# Altium schematic sheet RK3568-USB-PCIe-Sheet.SchDoc
size 420 x 297 mm; SheetNumber: 8; SheetTotal: 25
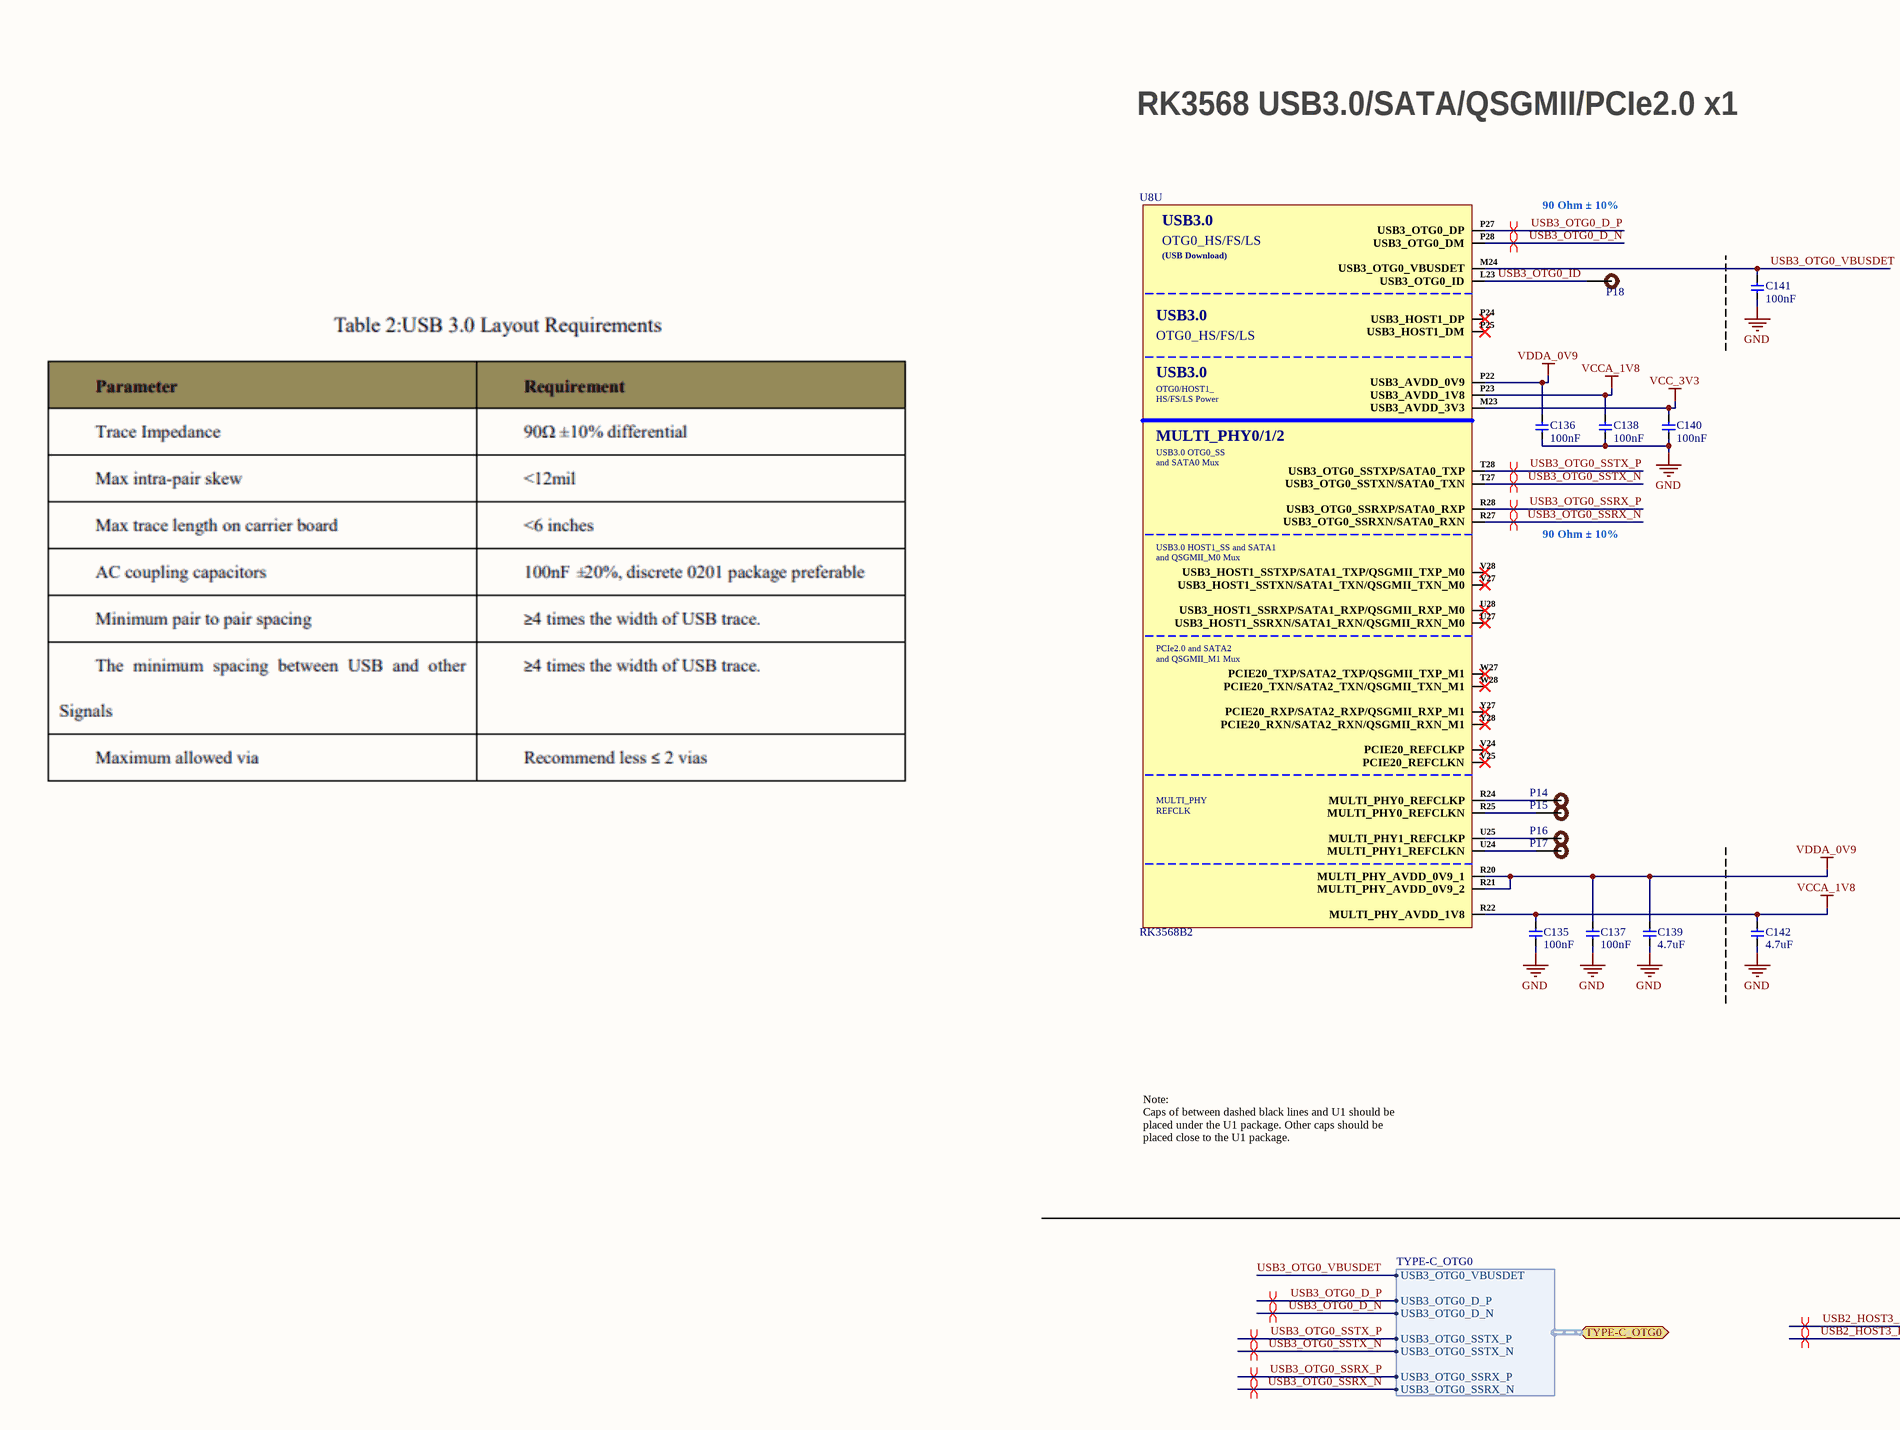
[diagram p0: RK3568-USB-PCIe-Sheet.SchDoc, left]
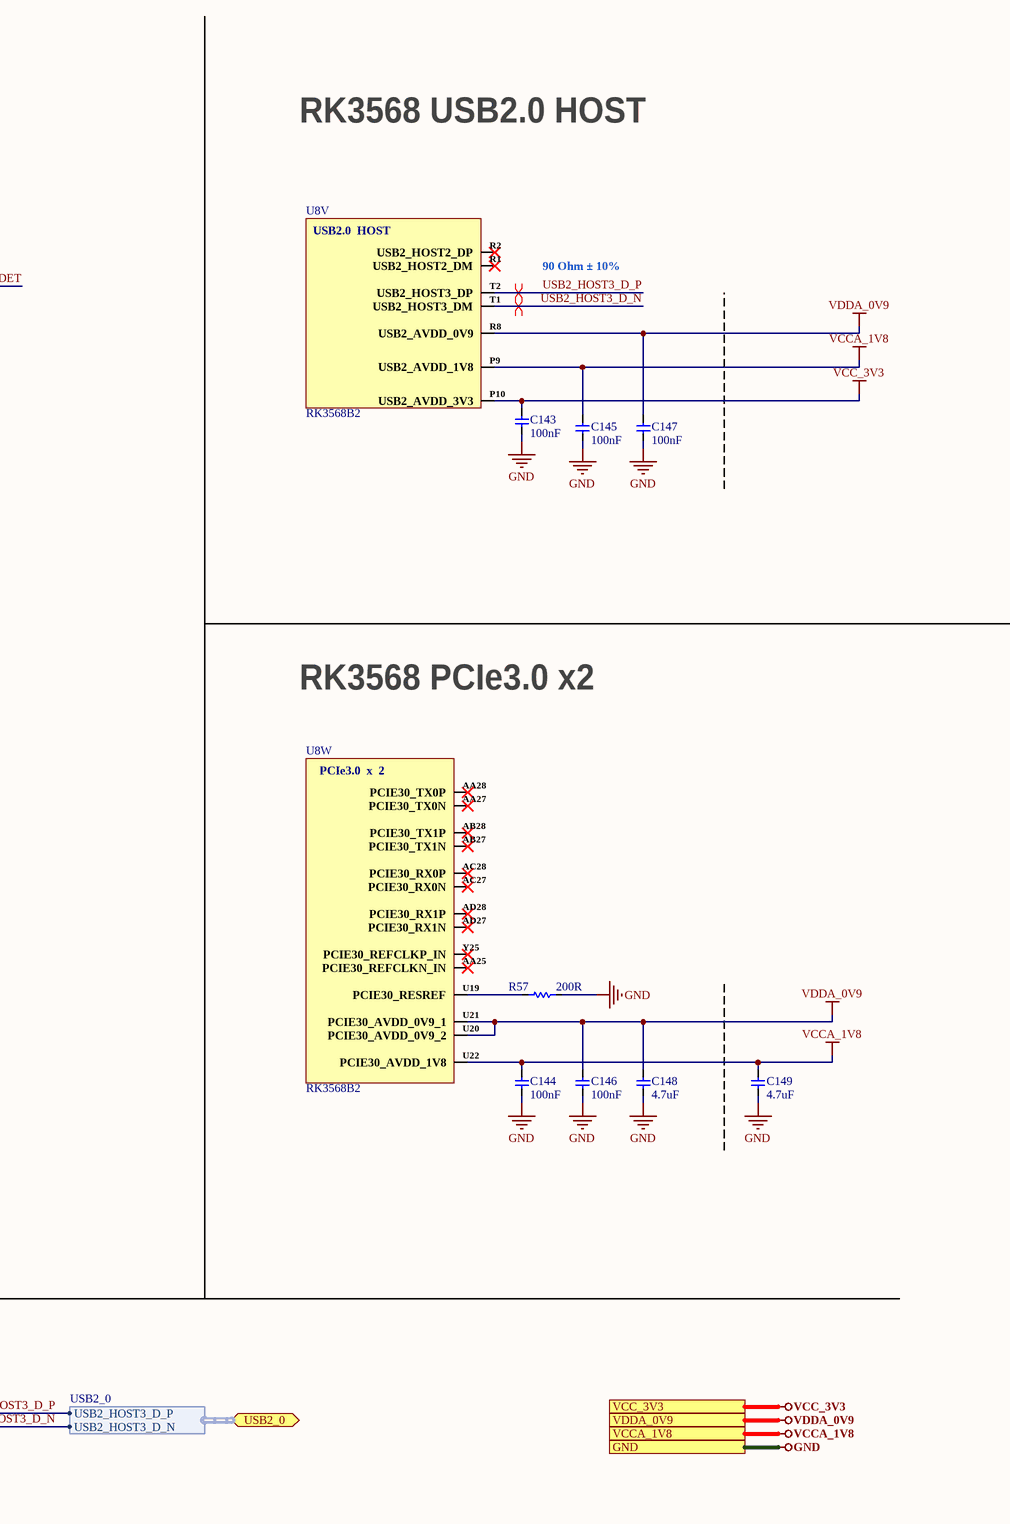
[diagram p1: RK3568-USB-PCIe-Sheet.SchDoc, right]

## Parts
C135  100nF  [CAP-0201]
C136  100nF  [CAP-0201]
C137  100nF  [CAP-0201]
C138  100nF  [CAP-0201]
C139  4.7uF  [Cap-0402]
C140  100nF  [CAP-0201]
C141  100nF  [CAP-0201]
C142  4.7uF  [Cap-0402]
C143  100nF  [CAP-0201]
C144  100nF  [CAP-0201]
C145  100nF  [CAP-0201]
C146  100nF  [CAP-0201]
C147  100nF  [CAP-0201]
C148  4.7uF  [Cap-0402]
C149  4.7uF  [Cap-0402]
P14  TEST POINT 0.5mm Dia  [Test-point - 0.5mm]  (value not drawn)  (no BOM)
P15  TEST POINT 0.5mm Dia  [Test-point - 0.5mm]  (value not drawn)  (no BOM)
P16  TEST POINT 0.5mm Dia  [Test-point - 0.5mm]  (value not drawn)  (no BOM)
P17  TEST POINT 0.5mm Dia  [Test-point - 0.5mm]  (value not drawn)  (no BOM)
P18  TEST POINT 0.5mm Dia  [Test-point - 0.5mm]  (value not drawn)  (no BOM)
R57  200R  [Res-0201]
U8  RK3568B2  [FCCSP-636L]  (parts U,V,W of 23)

## Ports
GND (see Connector-Sheet[5D], DRAM-LPDDR4x-Sheet[4D], eMMC-Sheet[4D], LED-Debug-Sheet[4D], MicroSD-SPI-Flash-Sheet[4D], Power-DC-IN-Sheet[4D], Power-Others-Sheet[4D], Power-PMIC-Sheet[4D], RK3568-Audio-Interface[4D], RK3568-Flash-SD-Controller[4D], RK3568-OSC-PMUIO-Sheet[5D], RK3568-Power-Sheet[4D], RK3568-SARADC-GPIO[4D], RK3568-VI-Interface-Sheet[4D], RK3568-VO-Interface-1[4D], RK3568-VO-Interface-2[4D], Sensors-Sheet-1[4D], Sensors-Sheet-2[5D], Type-C-Sheet[4D], USB-Ports[4D], VO-HDMI2.0-TX-Sheet[4D], VO-LCM-MIPI-DSI-TX0[4D], WIFI-BT-SDIO-Sheet[4D]), TYPE-C_OTG0 (bidir, harness TYPE-C_OTG0, see Type-C-Sheet[2D]), USB2_0 (bidir, harness USB2_0, see USB-Ports[2D]), VCC_3V3 (see eMMC-Sheet[4D], Power-PMIC-Sheet[4D], RK3568-SARADC-GPIO[4D], RK3568-VO-Interface-2[4D], VO-HDMI2.0-TX-Sheet[4D], WIFI-BT-SDIO-Sheet[4D]), VCCA_1V8 (see LED-Debug-Sheet[4D], Power-PMIC-Sheet[4D], RK3568-OSC-PMUIO-Sheet[5D], RK3568-SARADC-GPIO[4D]), VDDA_0V9 (see Power-PMIC-Sheet[3D], RK3568-OSC-PMUIO-Sheet[5D])

## Harnesses
TYPE-C_OTG0: USB3_OTG0_D_P, USB3_OTG0_D_N, USB3_OTG0_VBUSDET, USB3_OTG0_SSTX_P, USB3_OTG0_SSTX_N, USB3_OTG0_SSRX_P, USB3_OTG0_SSRX_N
USB2_0: USB2_HOST3_D_P, USB2_HOST3_D_N

## Nets
GND: C135.1 C136.1 C137.1 C138.1 C139.1 C140.1 C141.1 C142.1 C143.1 C144.1 C145.1 C146.1 C147.1 C148.1 C149.1 R57.2 ; port GND
VCC_3V3: C140.2 C143.2 U8.M23(USB3_AVDD_3V3) U8.P10(USB2_AVDD_3V3) ; port VCC_3V3
VCCA_1V8: C135.2 C138.2 C142.2 C144.2 C145.2 C149.2 U8.P9(USB2_AVDD_1V8) U8.P23(USB3_AVDD_1V8) U8.R22(MULTI_PHY_AVDD_1V8) U8.U22(PCIE30_AVDD_1V8) ; port VCCA_1V8
VDDA_0V9: C136.2 C137.2 C139.2 C146.2 C147.2 C148.2 U8.P22(USB3_AVDD_0V9) U8.R8(USB2_AVDD_0V9) U8.R20(MULTI_PHY_AVDD_0V9_1) U8.R21(MULTI_PHY_AVDD_0V9_2) U8.U20(PCIE30_AVDD_0V9_2) U8.U21(PCIE30_AVDD_0V9_1) ; port VDDA_0V9
USB2_HOST3_D_N: U8.T1(USB2_HOST3_DM) ; port USB2_0.USB2_HOST3_D_N
USB2_HOST3_D_P: U8.T2(USB2_HOST3_DP) ; port USB2_0.USB2_HOST3_D_P
USB3_OTG0_D_N: U8.P28(USB3_OTG0_DM) ; port TYPE-C_OTG0.USB3_OTG0_D_N
USB3_OTG0_D_P: U8.P27(USB3_OTG0_DP) ; port TYPE-C_OTG0.USB3_OTG0_D_P
USB3_OTG0_ID: P18.1 U8.L23(USB3_OTG0_ID)
USB3_OTG0_SSRX_N: U8.R27(USB3_OTG0_SSRXN/SATA0_RXN) ; port TYPE-C_OTG0.USB3_OTG0_SSRX_N
USB3_OTG0_SSRX_P: U8.R28(USB3_OTG0_SSRXP/SATA0_RXP) ; port TYPE-C_OTG0.USB3_OTG0_SSRX_P
USB3_OTG0_SSTX_N: U8.T27(USB3_OTG0_SSTXN/SATA0_TXN) ; port TYPE-C_OTG0.USB3_OTG0_SSTX_N
USB3_OTG0_SSTX_P: U8.T28(USB3_OTG0_SSTXP/SATA0_TXP) ; port TYPE-C_OTG0.USB3_OTG0_SSTX_P
USB3_OTG0_VBUSDET: C141.2 U8.M24(USB3_OTG0_VBUSDET) ; port TYPE-C_OTG0.USB3_OTG0_VBUSDET
NetP14_1: P14.1 U8.R24(MULTI_PHY0_REFCLKP)
NetP15_1: P15.1 U8.R25(MULTI_PHY0_REFCLKN)
NetP16_1: P16.1 U8.U25(MULTI_PHY1_REFCLKP)
NetP17_1: P17.1 U8.U24(MULTI_PHY1_REFCLKN)
NetR57_1: R57.1 U8.U19(PCIE30_RESREF)

Not connected (* = marked no-connect by the designer): U8 AA25(PCIE30_REFCLKN_IN)* AA27(PCIE30_TX0N)* AA28(PCIE30_TX0P)* AB27(PCIE30_TX1N)* AB28(PCIE30_TX1P)* AC27(PCIE30_RX0N)* AC28(PCIE30_RX0P)* AD27(PCIE30_RX1N)* AD28(PCIE30_RX1P)* P24(USB3_HOST1_DP)* P25(USB3_HOST1_DM)* R1(USB2_HOST2_DM)* R2(USB2_HOST2_DP)* U27(USB3_HOST1_SSRXN/SATA1_RXN/QSGMII_RXN_M0)* U28(USB3_HOST1_SSRXP/SATA1_RXP/QSGMII_RXP_M0)* V24(PCIE20_REFCLKP)* V25(PCIE20_REFCLKN)* V27(USB3_HOST1_SSTXN/SATA1_TXN/QSGMII_TXN_M0)* V28(USB3_HOST1_SSTXP/SATA1_TXP/QSGMII_TXP_M0)* W27(PCIE20_TXP/SATA2_TXP/QSGMII_TXP_M1)* W28(PCIE20_TXN/SATA2_TXN/QSGMII_TXN_M1)* Y25(PCIE30_REFCLKP_IN)* Y27(PCIE20_RXP/SATA2_RXP/QSGMII_RXP_M1)* Y28(PCIE20_RXN/SATA2_RXN/QSGMII_RXN_M1)*

## Layout directives
differential pair: USB2_HOST3_D_N, USB2_HOST3_D_P, USB3_OTG0_D_N, USB3_OTG0_D_P, USB3_OTG0_SSRX_N, USB3_OTG0_SSRX_P, USB3_OTG0_SSTX_N, USB3_OTG0_SSTX_P

## Notes on the sheet
- RK3568 USB3.0/SATA/QSGMII/PCIe2.0 x1
- RK3568 USB2.0 HOST
- 90 Ohm ± 10%
- RK3568 PCIe3.0 x2
- Note:
  Caps of between dashed black lines and U1 should be placed under the U1 package. Other caps should be placed close to the U1 package.
- File:
- Title:
- Date:
- Page
- Num:
- Total:
- Drawn By: Huzaifa Ali
- (in symbol RK3568B2, part U) USB3.0; OTG0_HS/FS/LS; (USB Download); OTG0/HOST1_  HS/FS/LS Power; MULTI_PHY0/1/2; USB3.0 OTG0_SS / and SATA0 Mux; USB3.0 HOST1_SS and SATA1 / and QSGMII_M0 Mux; PCIe2.0 and SATA2 / and QSGMII_M1 Mux; MULTI_PHY REFCLK
- (in symbol RK3568B2, part V) USB2.0  HOST
- (in symbol RK3568B2, part W) PCIe3.0  x  2

## Library data of the parts
C135-C138 C140 C141 C143-C147 = CC0201KRX5R6BB104: CAP CER 0.1UF 10V X5R 0201; Manufacturer: Yageo; Tolerance: 10%; Supplier 1: Mouser; Manufacturer Part Number: CC0201KRX5R6BB104; RoHS: Yes; Category: Ceramic Capacitors; Stock 1: 824403; Pricing 1: 1=0.10000, 10=0.02400, 50=0.02400, 100=0.01900, 1000=0.01100, 10000=0.00900 (USD); Mount: Surface Mount; Case/Package: 0201; Case Code (Imperial): 0201; Case Code (Metric): 0603; Weight: 6E-06oz; Min Operating Temperature: -55°C; Max Operating Temperature: 85°C; Capacitance: 100nF; Dielectric: X5R; Voltage Rating (DC): 10V; Packaging: Tape and Reel; Termination: SMD/SMT; Resistor Type: Ceramic; Voltage Rating: 10V; Series: CC; Construction: Flat; Length: 0.6mm; Width: 0.012inch; Height: 0.3mm; Thickness: 0.013inch; Depth: 0.3mm; Radiation Hardening: No; Lead Free: Lead Free; Halogen Free: Halogen Free; RoHS Compliant: Yes; ComponentLink1URL: https://datasheet.ciiva.com/11587/upy-gphc-x5r-4v-to-50v-12-11587190.pdf?src-supplier=Avnet; ComponentLink1Description: https://datasheet.ciiva.com/11587/upy-gphc-x5r-4v-to-50v-12-11587190.pdf?src-supplier=Avnet; Supplier Part Number 1: 603-CC201KRX5R6BB104; LCSC Part Number: C190183
C139 C142 C148 C149 = CC0402KRX5R5BB475: CAP CER 4.7UF 6.3V X5R 0402; Manufacturer: Yageo; Tolerance: 10%; Item Type: Capacitor; Supplier 1: Arrow Electronics; Manufacturer Part Number: CC0402KRX5R5BB475; RoHS: Yes; Category: Ceramic Capacitors; Stock 1: 890000; Pricing 1: 10000=0.02120, 20000=0.02030, 30000=0.02010, 50000=0.01930, 100000=0.01760, 250000=0.01630 (USD); Case/Package: 0402; Voltage Rating (DC): 6.3V; Dielectric: X5R; Capacitance: 4.7uF; Lead Free: Lead Free; Halogen Free: Halogen Free; RoHS Compliant: Yes; ComponentLink1URL: http://www.yageo.com/documents/recent/UPY-GPHC_X5R_4V-to-50V_25.pdf?src-supplier=Digi-Key; ComponentLink1Description: http://www.yageo.com/documents/recent/UPY-GPHC_X5R_4V-to-50V_25.pdf?src-supplier=Digi-Key; ComponentLink2URL: https://www.yageo.com/upload/media/product/productsearch/datasheet/mlcc/UPY-GPHC_X5R_4V-to-50V_26.pdf?src-supplier=Digi-Key; ComponentLink2Description: https://www.yageo.com/upload/media/product/productsearch/datasheet/mlcc/UPY-GPHC_X5R_4V-to-50V_26.pdf?src-supplier=Digi-Key; LCSC Part Number: C541466; Supplier Part Number 1: CC0402KRX5R5BB475
P14-P18 = TEST POINT 0.5mm Dia: Test Point ON; Item Type: Test Point; Manufacturer Part Number: TEST POINT 0.5mm Dia
R57 = RC0201FR-07200RL: RES 200 OHM 1% 1/20W 0201; Manufacturer: Yageo; Voltage Rating: 25V; Power Rating: 50mW; Temperature Coefficient: 200ppm/°C; Item Type: Resistor; Supplier 1: Avnet; Manufacturer Part Number: RC0201FR-07200RL; RoHS: Yes; Category: Chip SMD Resistors; Stock 1: 180000; Pricing 1: 10000=0.00128 (USD); Case/Package: 0201; Case Code (Imperial): 0201; Case Code (Metric): 0603; Size Code: 0201; Min Operating Temperature: -55°C; Max Operating Temperature: 125°C; Package Quantity: 10000; Resistance: 200R; Tolerance: 1%; Packaging: Tape and Reel; Resistor Type: Thick Film; Termination: SMD/SMT; Number of Terminations: 2; Max Power Dissipation: 50mW; Features: Moisture Resistant; Series: RC; Construction: Rectangular; Length: 0.6mm; Width: 0.3mm; Height: 0.01inch; Depth: 0.3mm; Military Standard: Not; Lead Free: Lead Free; RoHS Compliant: Yes; ComponentLink1URL: http://www.mouser.com/ds/2/447/RC0201-559633.pdf?src-supplier=Mouser; ComponentLink1Description: http://www.mouser.com/ds/2/447/RC0201-559633.pdf?src-supplier=Mouser; ComponentLink2URL: http://www.yageo.com/documents/recent/PYu-RC0201_51_RoHS_L_(8).pdf?src-supplier=Future+Electronics; ComponentLink2Description: http://www.yageo.com/documents/recent/PYu-RC0201_51_RoHS_L_(8).pdf?src-supplier=Future+Electronics; ComponentLink3URL: http://www.yageo.com/documents/recent/PYu-RC_Group_51_RoHS_L_10.pdf?src-supplier=Digi-Key; ComponentLink3Description: http://www.yageo.com/documents/recent/PYu-RC_Group_51_RoHS_L_10.pdf?src-supplier=Digi-Key; ComponentLink4URL: http://www.yageo.com/documents/recent/PYu-RC_Group_51_RoHS_L_9.pdf?src-supplier=Digi-Key; ComponentLink4Description: http://www.yageo.com/documents/recent/PYu-RC_Group_51_RoHS_L_9.pdf?src-supplier=Digi-Key; Supplier Part Number 1: RC0201FR-07200RL; LCSC Part Number: C274337
U8 = RK3568B2: FCCSP-636L Microcontroller Units (MCUs/MPUs/SOCs) ROHS; Manufacturer: Rockchip; Item Type: IC; Manufacturer Part Number: RK3568B2; Package: FCCSP-636L; LCSC Part Number: C3345225